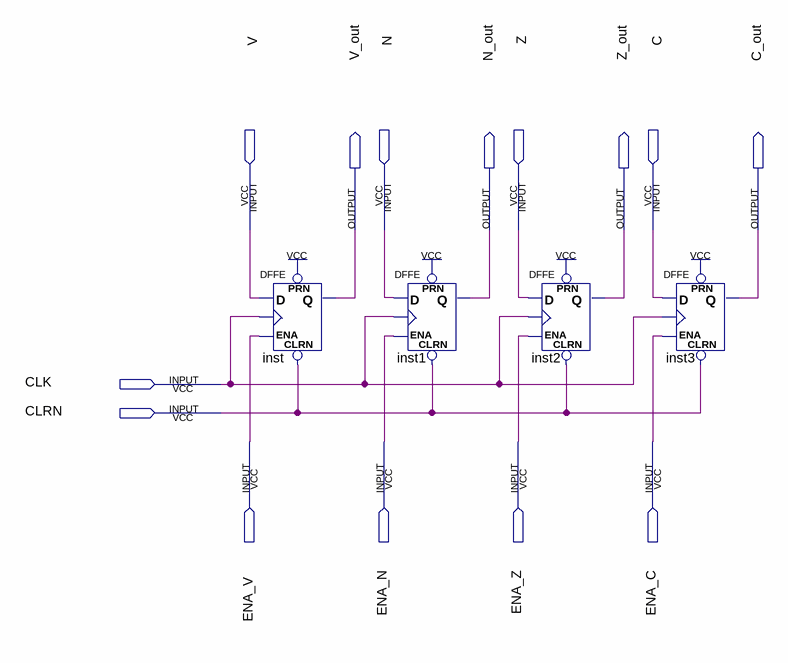
[diagram p0: schematic sheet]
// Quartus schematic registro-estado.bdf as structural Verilog: 4 symbols, 14 pins
module \registro-estado  (
  input  V,
  input  N,
  input  Z,
  input  C,
  input  CLK,
  input  CLRN,
  input  ENA_V,
  input  ENA_N,
  input  ENA_Z,
  input  ENA_C,
  output V_out,
  output N_out,
  output Z_out,
  output C_out
);

  DFFE inst (.PRN(1'b1), .CLRN(CLRN), .D(V), .CLK(CLK), .ENA(ENA_V), .Q(V_out));
  DFFE inst1 (.PRN(1'b1), .CLRN(CLRN), .D(N), .CLK(CLK), .ENA(ENA_N), .Q(N_out));
  DFFE inst2 (.PRN(1'b1), .CLRN(CLRN), .D(Z), .CLK(CLK), .ENA(ENA_Z), .Q(Z_out));
  DFFE inst3 (.PRN(1'b1), .CLRN(CLRN), .D(C), .CLK(CLK), .ENA(ENA_C), .Q(C_out));
endmodule
